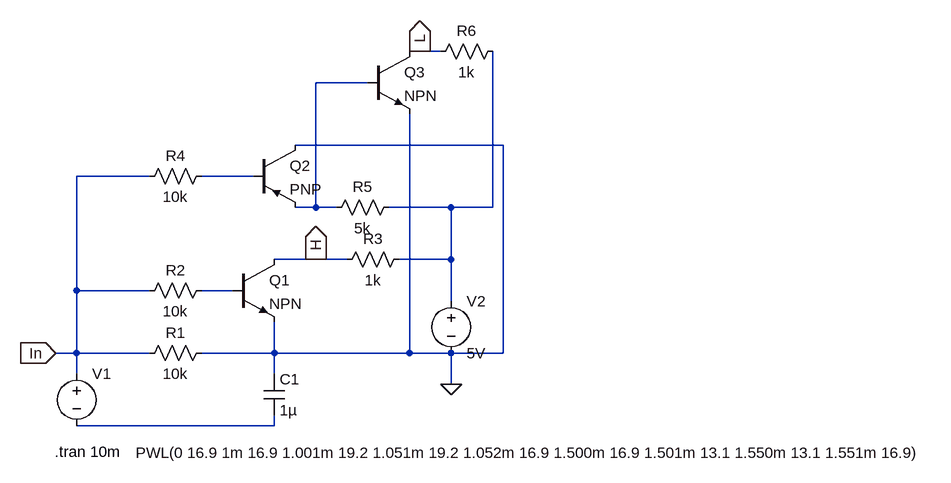
[diagram p0: schematic Pegelkonverter2.asc]
Pegelkonverter2.asc, the LTspice schematic file:
Version 4
SHEET 1 1288 680
WIRE 512 -928 496 -928
WIRE 544 -928 512 -928
WIRE 432 -880 352 -880
WIRE 640 -784 320 -784
WIRE 96 -736 -16 -736
WIRE 256 -736 176 -736
WIRE 352 -688 352 -880
WIRE 352 -688 320 -688
WIRE 384 -688 352 -688
WIRE 560 -688 464 -688
WIRE 624 -688 624 -928
WIRE 624 -688 560 -688
WIRE 352 -608 288 -608
WIRE 400 -608 352 -608
WIRE 560 -608 560 -688
WIRE 560 -608 480 -608
WIRE -16 -560 -16 -736
WIRE 96 -560 -16 -560
WIRE 224 -560 176 -560
WIRE 560 -544 560 -608
WIRE -16 -464 -16 -560
WIRE -16 -464 -48 -464
WIRE 96 -464 -16 -464
WIRE 288 -464 288 -512
WIRE 288 -464 176 -464
WIRE 496 -464 496 -832
WIRE 496 -464 288 -464
WIRE 560 -464 496 -464
WIRE 640 -464 640 -784
WIRE 640 -464 560 -464
WIRE -16 -432 -16 -464
WIRE 288 -432 288 -464
WIRE 560 -416 560 -464
WIRE 288 -352 288 -368
WIRE 288 -352 -16 -352
FLAG 560 -416 0
FLAG -48 -464 In
IOPIN -48 -464 In
FLAG 512 -928 L
IOPIN 512 -928 Out
FLAG 352 -608 H
IOPIN 352 -608 Out
SYMBOL voltage -16 -448 R0
WINDOW 3 91 137 Left 2
WINDOW 123 0 0 Left 0
WINDOW 39 0 0 Left 0
SYMATTR InstName V1
SYMATTR Value PWL(0 16.9 1m 16.9 1.001m 19.2 1.051m 19.2 1.052m 16.9 1.500m 16.9 1.501m 13.1 1.550m 13.1 1.551m 16.9)
SYMBOL res 192 -480 R90
WINDOW 0 0 56 VBottom 2
WINDOW 3 32 56 VTop 2
SYMATTR InstName R1
SYMATTR Value 10k
SYMBOL cap 272 -432 R0
SYMATTR InstName C1
SYMATTR Value 1µ
SYMBOL npn 224 -608 R0
SYMATTR InstName Q1
SYMBOL res 192 -576 R90
WINDOW 0 0 56 VBottom 2
WINDOW 3 32 56 VTop 2
SYMATTR InstName R2
SYMATTR Value 10k
SYMBOL voltage 560 -560 R0
WINDOW 123 0 0 Left 0
WINDOW 39 0 0 Left 0
SYMATTR InstName V2
SYMATTR Value 5V
SYMBOL res 496 -624 R90
WINDOW 0 0 56 VBottom 2
WINDOW 3 32 56 VTop 2
SYMATTR InstName R3
SYMATTR Value 1k
SYMBOL pnp 256 -784 R0
SYMATTR InstName Q2
SYMBOL res 192 -752 R90
WINDOW 0 0 56 VBottom 2
WINDOW 3 32 56 VTop 2
SYMATTR InstName R4
SYMATTR Value 10k
SYMBOL res 480 -704 R90
WINDOW 0 0 56 VBottom 2
WINDOW 3 32 56 VTop 2
SYMATTR InstName R5
SYMATTR Value 5k
SYMBOL npn 432 -928 R0
SYMATTR InstName Q3
SYMBOL res 640 -944 R90
WINDOW 0 0 56 VBottom 2
WINDOW 3 32 56 VTop 2
SYMATTR InstName R6
SYMATTR Value 1k
TEXT -50 -312 Left 2 !.tran 10m

The netlist it stands for:
* Pegelkonverter2.asc
V1 In N005 PWL(0 16.9 1m 16.9 1.001m 19.2 1.051m 19.2 1.052m 16.9 1.500m 16.9 1.501m 13.1 1.550m 13.1 1.551m 16.9)
R1 0 In 10k
C1 0 N005 1µ
Q1 H N004 0 0 NPN
R2 N004 In 10k
V2 N003 0 5V
R3 N003 H 1k
Q2 0 N002 N001 0 PNP
R4 N002 In 10k
R5 N003 N001 5k
Q3 L N001 0 0 NPN
R6 N003 L 1k
.model NPN NPN
.model PNP PNP
.lib standard.bjt
.tran 10m
.backanno
.end